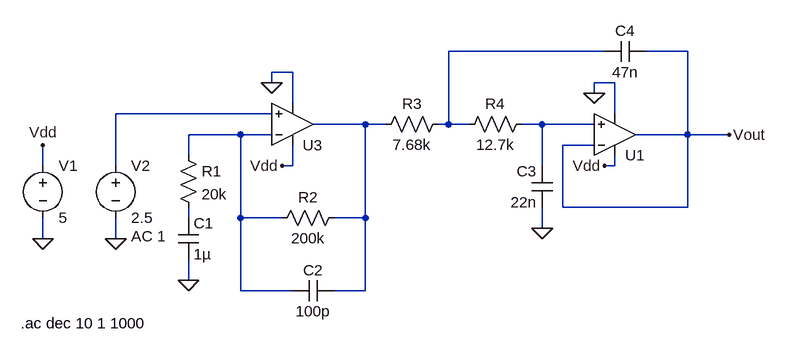
[diagram p0: schematic preamp-sallenkey.asc]
preamp-sallenkey.asc, the LTspice schematic file:
Version 4
SHEET 1 880 680
WIRE 592 -16 352 -16
WIRE 720 -16 656 -16
WIRE 112 16 80 16
WIRE 80 32 80 16
WIRE 608 32 576 32
WIRE 576 48 576 32
WIRE 112 64 112 16
WIRE 80 80 -160 80
WIRE 608 80 608 32
WIRE 224 96 144 96
WIRE 256 96 224 96
WIRE 352 96 352 -16
WIRE 352 96 336 96
WIRE 384 96 352 96
WIRE 496 96 464 96
WIRE 576 96 496 96
WIRE 32 112 -48 112
WIRE 80 112 32 112
WIRE 720 112 720 -16
WIRE 720 112 640 112
WIRE 784 112 720 112
WIRE 576 128 528 128
WIRE -48 144 -48 112
WIRE -272 160 -272 128
WIRE -160 160 -160 80
WIRE 112 160 112 128
WIRE 112 160 96 160
WIRE 496 160 496 96
WIRE 608 160 608 144
WIRE 608 160 592 160
WIRE 528 224 528 128
WIRE 720 224 720 112
WIRE 720 224 528 224
WIRE -48 240 -48 224
WIRE 32 240 32 112
WIRE 96 240 32 240
WIRE 224 240 224 96
WIRE 224 240 176 240
WIRE 496 256 496 224
WIRE -272 272 -272 240
WIRE -160 272 -160 240
WIRE -48 336 -48 304
WIRE 32 352 32 240
WIRE 112 352 32 352
WIRE 224 352 224 240
WIRE 224 352 176 352
FLAG 80 32 0
FLAG 96 160 Vdd
FLAG 496 256 0
FLAG 576 48 0
FLAG 592 160 Vdd
FLAG -272 272 0
FLAG -272 128 Vdd
FLAG 784 112 Vout
FLAG -160 272 0
FLAG -48 336 0
SYMBOL res -64 128 R0
SYMATTR InstName R1
SYMATTR Value 20k
SYMBOL cap -64 240 R0
SYMATTR InstName C1
SYMATTR Value 1µ
SYMBOL res 192 224 R90
WINDOW 0 0 56 VBottom 2
WINDOW 3 32 56 VTop 2
SYMATTR InstName R2
SYMATTR Value 200k
SYMBOL cap 176 336 R90
WINDOW 0 0 32 VBottom 2
WINDOW 3 32 32 VTop 2
SYMATTR InstName C2
SYMATTR Value 100p
SYMBOL res 352 80 R90
WINDOW 0 0 56 VBottom 2
WINDOW 3 32 56 VTop 2
SYMATTR InstName R3
SYMATTR Value 7.68k
SYMBOL res 480 80 R90
WINDOW 0 0 56 VBottom 2
WINDOW 3 32 56 VTop 2
SYMATTR InstName R4
SYMATTR Value 12.7k
SYMBOL cap 512 224 R180
WINDOW 0 24 56 Left 2
WINDOW 3 24 8 Left 2
SYMATTR InstName C3
SYMATTR Value 22n
SYMBOL cap 592 0 R270
WINDOW 0 32 32 VTop 2
WINDOW 3 0 32 VBottom 2
SYMATTR InstName C4
SYMATTR Value 47n
SYMBOL voltage -272 144 R0
WINDOW 123 0 0 Left 0
WINDOW 39 0 0 Left 0
SYMATTR InstName V1
SYMATTR Value 5
SYMBOL voltage -160 144 R0
WINDOW 123 24 124 Left 2
WINDOW 39 0 0 Left 0
SYMATTR InstName V2
SYMATTR Value 2.5
SYMATTR Value2 AC 1
SYMBOL OpAmps\\UniversalOpAmp2 112 96 M180
SYMATTR InstName U3
SYMBOL OpAmps\\UniversalOpAmp2 608 112 M180
SYMATTR InstName U1
TEXT -306 402 Left 2 !.ac dec 10 1 1000

The netlist it stands for:
* preamp-sallenkey.asc
R1 N005 N006 20k
C1 N006 0 1µ
R2 N003 N005 200k
C2 N003 N005 100p
R3 N001 N003 7.68k
R4 N004 N001 12.7k
C3 0 N004 22n
C4 N001 Vout 47n
V1 Vdd 0 5
V2 N002 0 2.5 AC 1
XU3 N002 N005 Vdd 0 N003 level2 Avol=1Meg GBW=10Meg Slew=10Meg Ilimit=25m Rail=0 Vos=0 En=0 Enk=0 In=0 Ink=0 Rin=500Meg  ; pins In+ In- V+ V- OUT
XU1 N004 Vout Vdd 0 Vout level2 Avol=1Meg GBW=10Meg Slew=10Meg Ilimit=25m Rail=0 Vos=0 En=0 Enk=0 In=0 Ink=0 Rin=500Meg  ; pins In+ In- V+ V- OUT
.ac dec 10 1 1000
.lib UniversalOpAmp2.lib
.backanno
.end